# Altium project SmartSwitchD2_MainBoard_1v2.PrjPcb
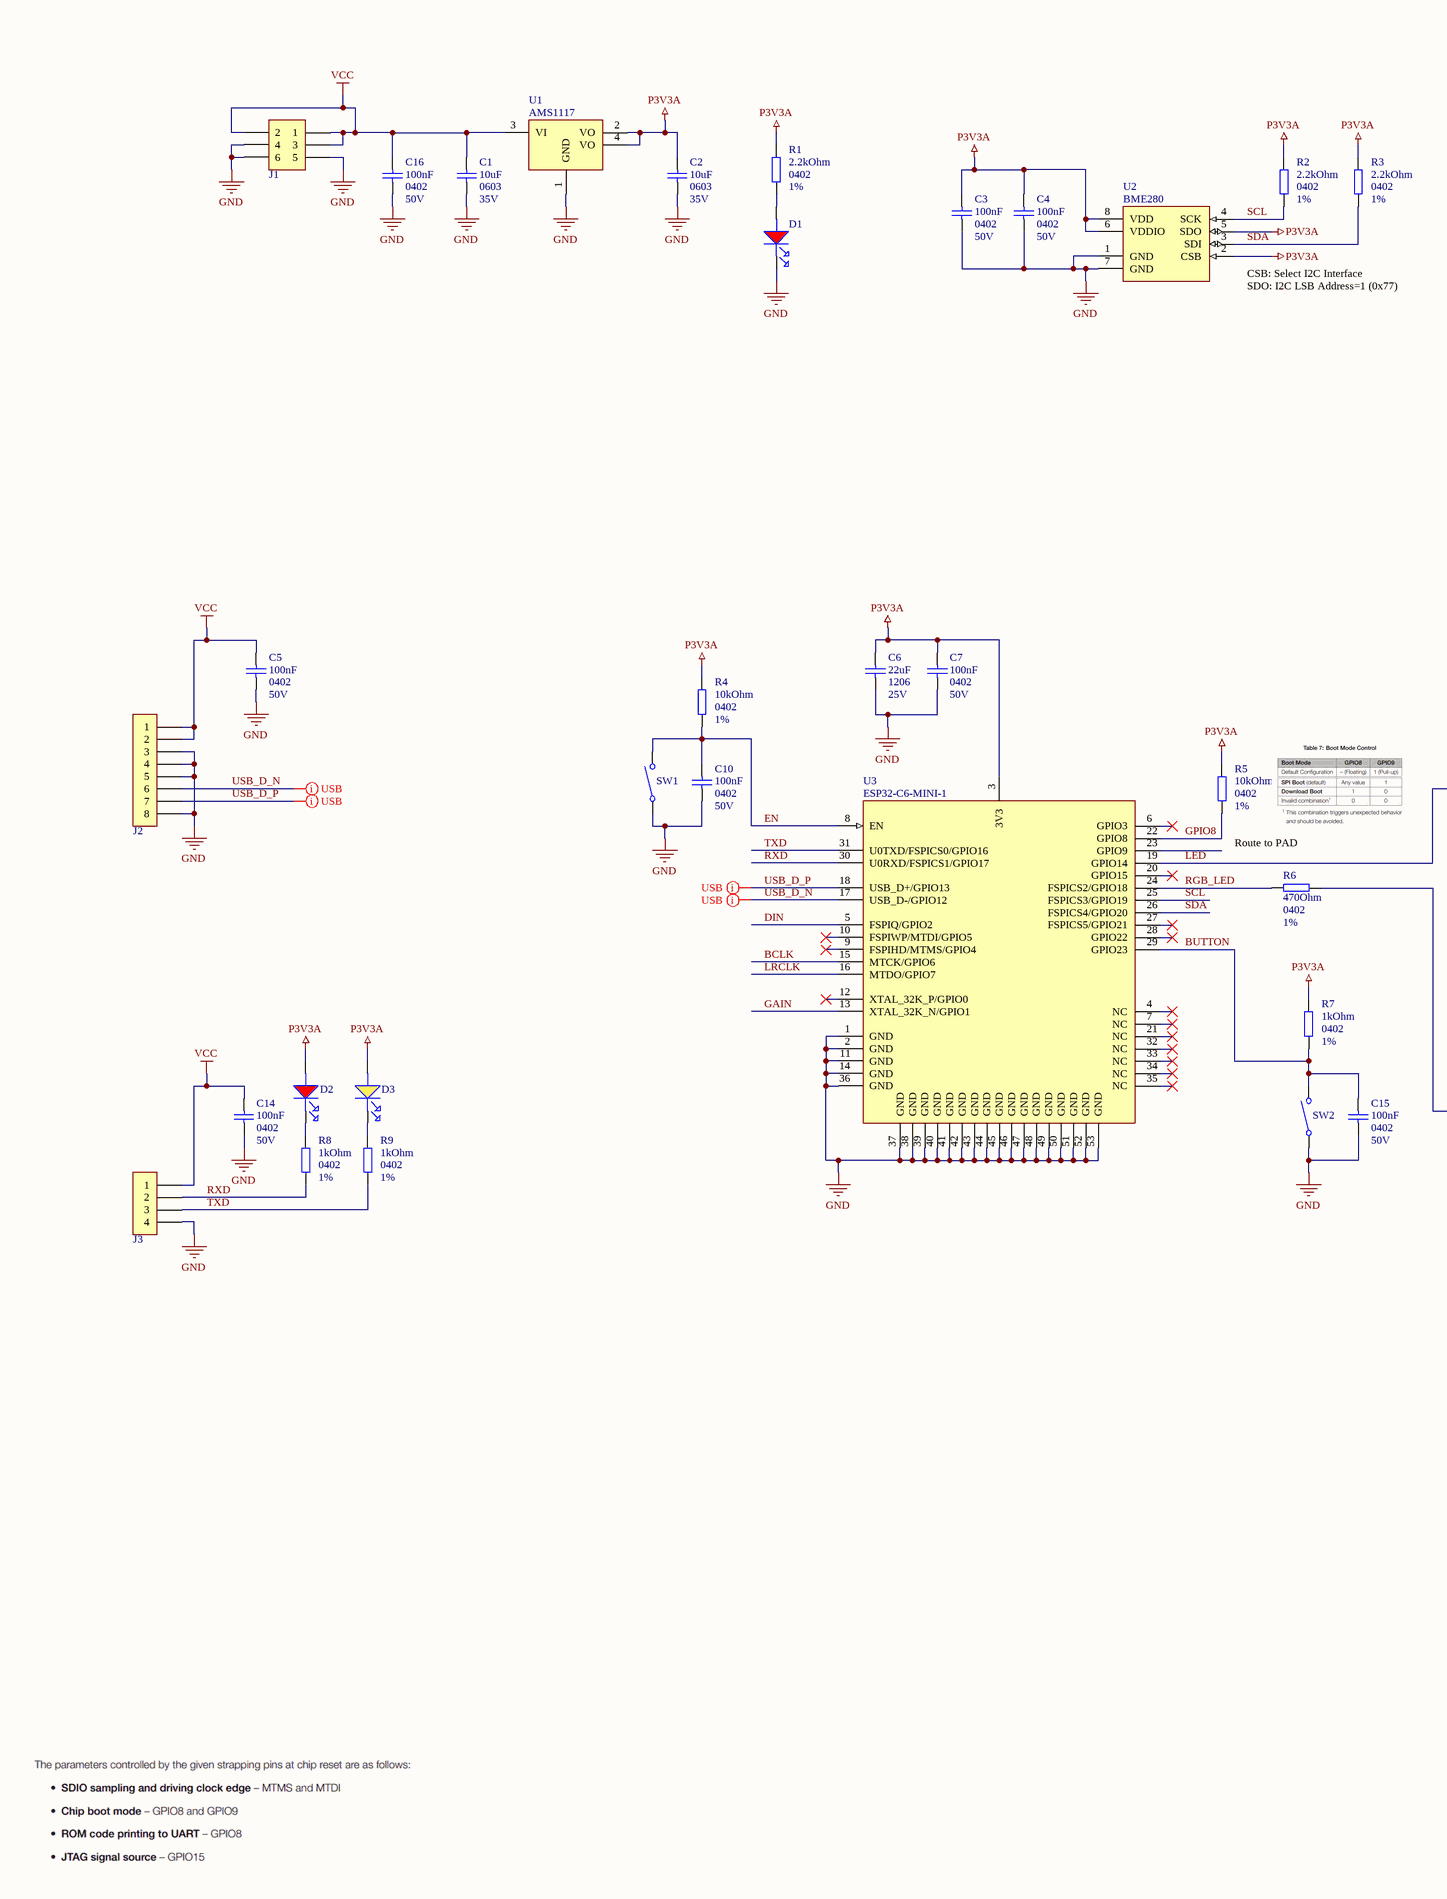
[diagram p0: 0_Main.SchDoc, left]
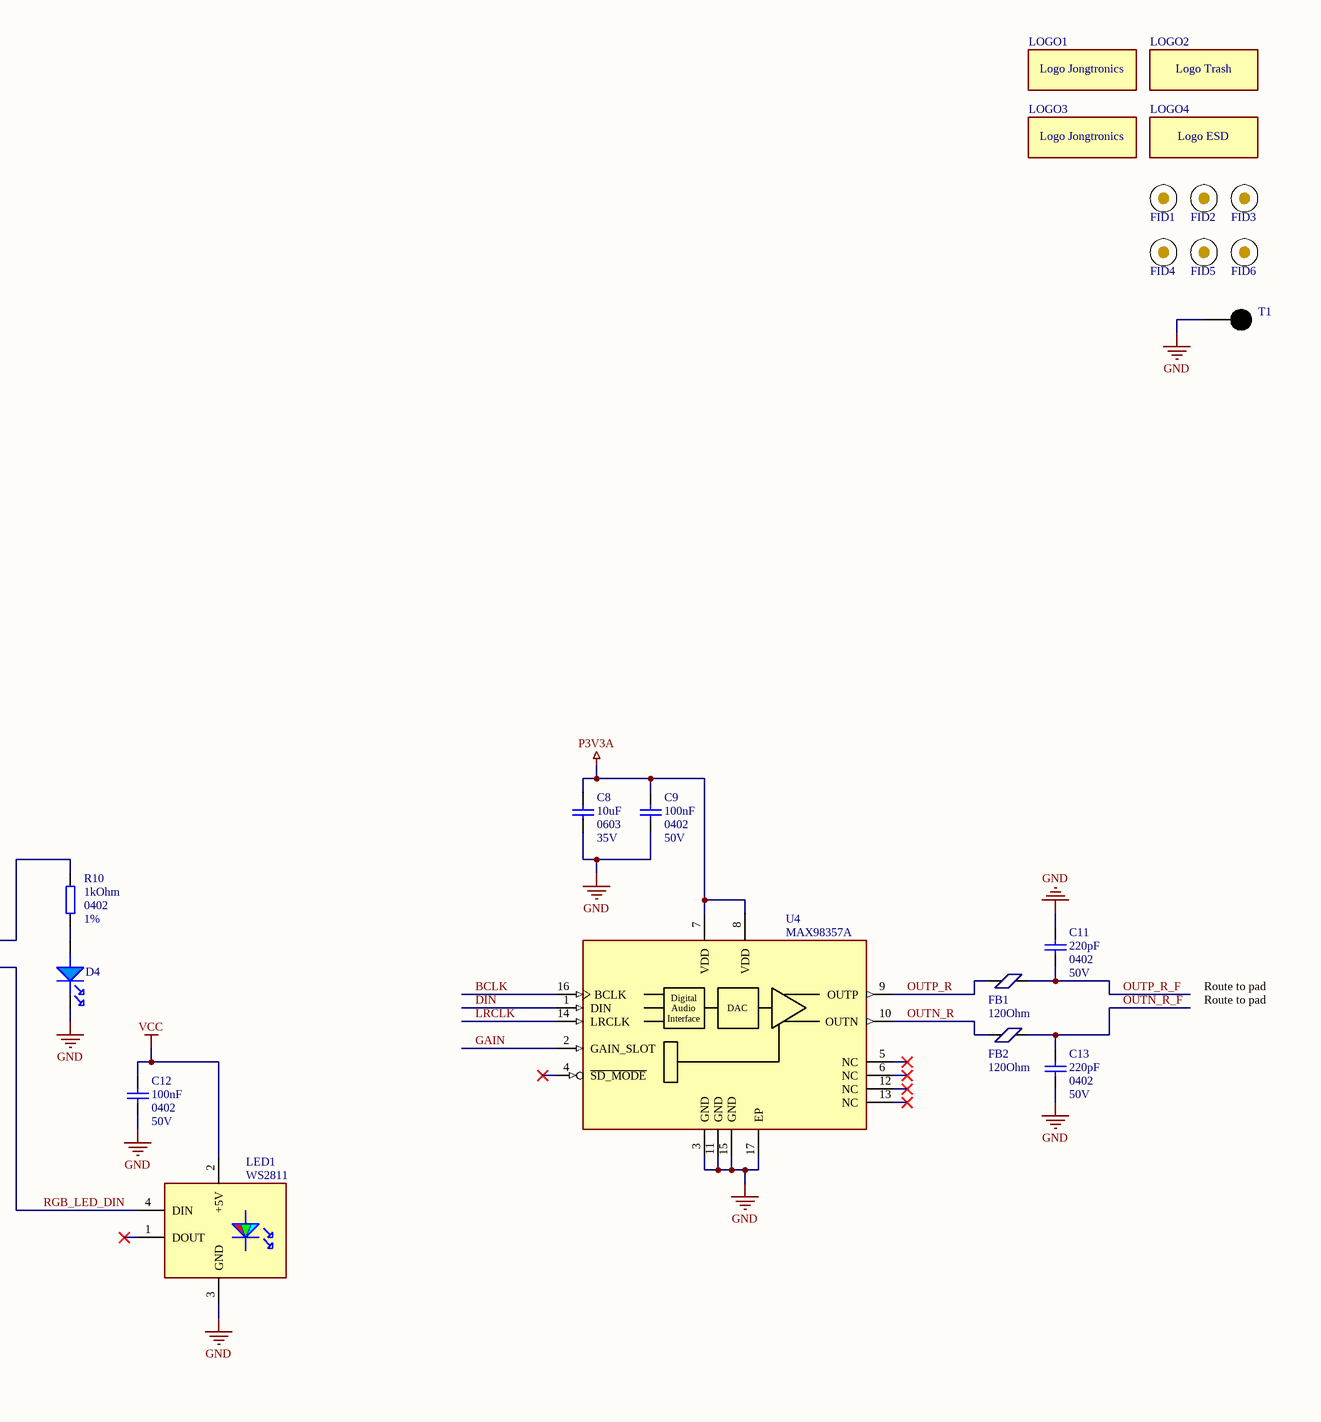
[diagram p1: 0_Main.SchDoc, right]
1 sheet, 53 parts. Net scope: global (net labels, ports and power ports of the same name join across sheets).
Board files: SmartSwitchD2_MainBoard_1v2.PCBDOC, SmartSwitch_PCB.PcbDoc

## Sheet 0_Main.SchDoc
size A2; DocumentNumber: 1; SheetNumber: 1; SheetTotal: 1

### Parts
C1  value 10uF  Footprint: 0603  Rated Voltage: 35V  [C0603]  (hidden comment: CAP-0603 10uF 35VDC 20% X5R)
C2  value 10uF  Footprint: 0603  Rated Voltage: 35V  [C0603]  (hidden comment: CAP-0603 10uF 35VDC 20% X5R)
C3  value 100nF  Footprint: 0402  Rated Voltage: 50V  [C0402]  (hidden comment: CAP-0402 100nF 50VDC 10% X7R)
C4  value 100nF  Footprint: 0402  Rated Voltage: 50V  [C0402]  (hidden comment: CAP-0402 100nF 50VDC 10% X7R)
C5  value 100nF  Footprint: 0402  Rated Voltage: 50V  [C0402]  (hidden comment: CAP-0402 100nF 50VDC 10% X7R)
C6  value 22uF  Footprint: 1206  Rated Voltage: 25V  [C1206]  (hidden comment: CAP-1206 22uF 25VDC 10% X5R)
C7  value 100nF  Footprint: 0402  Rated Voltage: 50V  [C0402]  (hidden comment: CAP-0402 100nF 50VDC 10% X7R)
C8  value 10uF  Footprint: 0603  Rated Voltage: 35V  [C0603]  (hidden comment: CAP-0603 10uF 35VDC 20% X5R)
C9  value 100nF  Footprint: 0402  Rated Voltage: 50V  [C0402]  (hidden comment: CAP-0402 100nF 50VDC 10% X7R)
C10  value 100nF  Footprint: 0402  Rated Voltage: 50V  [C0402]  (hidden comment: CAP-0402 100nF 50VDC 10% X7R)
C11  value 220pF  Footprint: 0402  Rated Voltage: 50V  [C0402]  (hidden comment: CAP-0402 220pF 50VDC 10% X7R)
C12  value 100nF  Footprint: 0402  Rated Voltage: 50V  [C0402]  (hidden comment: CAP-0402 100nF 50VDC 10% X7R)
C13  value 220pF  Footprint: 0402  Rated Voltage: 50V  [C0402]  (hidden comment: CAP-0402 220pF 50VDC 10% X7R)
C14  value 100nF  Footprint: 0402  Rated Voltage: 50V  [C0402]  (hidden comment: CAP-0402 100nF 50VDC 10% X7R)
C15  value 100nF  Footprint: 0402  Rated Voltage: 50V  [C0402]  (hidden comment: CAP-0402 100nF 50VDC 10% X7R)
C16  value 100nF  Footprint: 0402  Rated Voltage: 50V  [C0402]  (hidden comment: CAP-0402 100nF 50VDC 10% X7R)
D1  LED-0402 Red 1.8V 1mA  [LED0402]  (value not drawn)
D2  LED-0402 Red 1.8V 1mA  [LED0402]  (value not drawn)
D3  LED-0402 Yellow 1.9V 1mA  [LED0402]  (value not drawn)
D4  LED-0402 Blue 2.65V 2mA  [LED0402]  (value not drawn)
FB1  value 120Ohm  [FB0402]  (hidden comment: FB-0402 120R 0.55A 250mOhms)
FB2  value 120Ohm  [FB0402]  (hidden comment: FB-0402 120R 0.55A 250mOhms)
FID1  Fiducial  [FIDUCIAL]  (value not drawn)  (no BOM)
FID2  Fiducial  [FIDUCIAL]  (value not drawn)  (no BOM)
FID3  Fiducial  [FIDUCIAL]  (value not drawn)  (no BOM)
FID4  Fiducial  [FIDUCIAL]  (value not drawn)  (no BOM)
FID5  Fiducial  [FIDUCIAL]  (value not drawn)  (no BOM)
FID6  Fiducial  [FIDUCIAL]  (value not drawn)  (no BOM)
J1  Header Female 2x3 - 4.6mm height - 0.05" (1.27mm)  [HEADER FEMALE 2x3 1.27MM]  (value not drawn)
J2  PCB Connector JST SH1.0mm pitch SMD 1x8 Top Entry  [BM08B-SRSS-TB]  (value not drawn)
J3  PCB Connector JST SH1.0mm pitch SMD 1x4 Side Entry  [SM04B-SRSS-TB]  (value not drawn)
LED1  Footprint: WS2811  [WS2811 DIP]  (hidden comment: LED RGB 256 Levels 5V 5mm)
LOGO1  Logo Jongtronics  [LOGO_JONGTRONICS]  (value not drawn)  (no BOM)
LOGO2  Logo Trash  [LOGO_TRASH]  (value not drawn)  (no BOM)
LOGO3  Logo Jongtronics  [LOGO_JONGTRONICS]  (value not drawn)  (no BOM)
LOGO4  Logo ESD  [LOGO_ESD]  (value not drawn)  (no BOM)
R1  value 2.2kOhm  Footprint: 0402  Tolerance: 1%  [R0402]  (hidden comment: RES-0402 2.2k 50V 1% 62.5mW)
R2  value 2.2kOhm  Footprint: 0402  Tolerance: 1%  [R0402]  (hidden comment: RES-0402 2.2k 50V 1% 62.5mW)
R3  value 2.2kOhm  Footprint: 0402  Tolerance: 1%  [R0402]  (hidden comment: RES-0402 2.2k 50V 1% 62.5mW)
R4  value 10kOhm  Footprint: 0402  Tolerance: 1%  [R0402]  (hidden comment: RES-0402 10k 50V 1% 62.5mW)
R5  value 10kOhm  Footprint: 0402  Tolerance: 1%  [R0402]  (hidden comment: RES-0402 10k 50V 1% 62.5mW)
R6  value 470Ohm  Footprint: 0402  Tolerance: 1%  [R0402]  (hidden comment: RES-0402 470R 50V 1% 62.5mW)
R7  value 1kOhm  Footprint: 0402  Tolerance: 1%  [R0402]  (hidden comment: RES-0402 1k 50V 1% 125mW)
R8  value 1kOhm  Footprint: 0402  Tolerance: 1%  [R0402]  (hidden comment: RES-0402 1k 50V 1% 125mW)
R9  value 1kOhm  Footprint: 0402  Tolerance: 1%  [R0402]  (hidden comment: RES-0402 1k 50V 1% 125mW)
R10  value 1kOhm  Footprint: 0402  Tolerance: 1%  [R0402]  (hidden comment: RES-0402 1k 50V 1% 125mW)
SW1  Tactile Switch SMD/SMT PTS815  [SW PTS815 SJK 250]  (value not drawn)
SW2  Gateron KS-27 Low Profile 2.0 Mechanical Switch Set  [GATERON KS-27]  (value not drawn)
T1  PCB Test point BLACK 1mm hole  [TESTPIN BLACK 1MM]  (value not drawn)
U1  Linear LDO 3.3V 800mA  [SOT-223-4]  (value not drawn)
U2  Digital Sensor Temperature,Humidity,Pressure  [LGA-8]  (value not drawn)
U3  Part Number: ESP32-C6-MINI-1  [ESP32-CX-MINI-1]  (hidden comment: 2.4 GHz WiFi, Bluetooth 5 (LE), Zigbee and Thread module)
U4  Tiny, Low-Cost, PCM Class D Amplifier  [TQFN-16]  (value not drawn)

### Nets
GND: C1.1 C2.1 C3.1 C4.1 C5.1 C6.1 C7.1 C8.1 C9.1 C10.1 C11.1 C12.1 C13.1 C14.1 C15.1 C16.1 D1.1(K) D4.1 J1.4 J1.5 J1.6 J2.3 J2.4 J2.5 J2.8 J3.4 LED1.3(GND) SW1.1 SW2.1 T1.1 U1.1(GND) U2.1(GND) U2.7(GND) U3.1(GND) U3.2(GND) U3.11(GND) U3.14(GND) U3.36(GND) U3.37(GND) U3.38(GND) U3.39(GND) U3.40(GND) U3.41(GND) U3.42(GND) U3.43(GND) U3.44(GND) U3.45(GND) U3.46(GND) U3.47(GND) U3.48(GND) U3.49(GND) U3.50(GND) U3.51(GND) U3.52(GND) U3.53(GND) U4.3(GND) U4.11(GND) U4.15(GND) U4.17(EP)
P3V3A: C2.2 C3.2 C4.2 C6.2 C7.2 C8.2 C9.2 D2.2(A) D3.2(A) R1.2 R2.2 R3.2 R4.2 R5.2 R7.2 U1.2(VO) U1.4(VO) U2.2(CSB) U2.5(SDO) U2.6(VDDIO) U2.8(VDD) U3.3(3V3) U4.7(VDD) U4.8(VDD)
VCC: C1.2 C5.2 C12.2 C14.2 C16.2 J1.1 J1.2 J1.3 J2.1 J2.2 J3.1 LED1.2(+5V) U1.3(VI)
BCLK: U3.15(MTCK/GPIO6) U4.16(BCLK)
BUTTON: C15.2 R7.1 SW2.2 U3.29(GPIO23)
DIN: U3.5(FSPIQ/GPIO2) U4.1(DIN)
EN: C10.2 R4.1 SW1.2 U3.8(EN)
GAIN: U3.13(XTAL_32K_N/GPIO1) U4.2(GAIN_SLOT)
GPIO8: R5.1 U3.22(GPIO8)
LED: R10.2 U3.19(GPIO14)
LRCLK: U3.16(MTDO/GPIO7) U4.14(LRCLK)
OUTN_R: FB2.1 U4.10(OUTN)
OUTN_R_F: C13.2 FB2.2
OUTP_R: FB1.1 U4.9(OUTP)
OUTP_R_F: C11.2 FB1.2
RGB_LED: R6.2 U3.24(FSPICS2/GPIO18)
RGB_LED_DIN: LED1.4(DIN) R6.1
RXD: J3.2 R8.1 U3.30(U0RXD/FSPICS1/GPIO17)
SCL: R2.1 U2.4(SCK) U3.25(FSPICS3/GPIO19)
SDA: R3.1 U2.3(SDI) U3.26(FSPICS4/GPIO20)
TXD: J3.3 R9.1 U3.31(U0TXD/FSPICS0/GPIO16)
USB_D_N: J2.6 U3.17(USB_D-/GPIO12)
USB_D_P: J2.7 U3.18(USB_D+/GPIO13)
NetD1_2: D1.2(A) R1.1
NetD2_1: D2.1(K) R8.2
NetD3_1: D3.1(K) R9.2
NetD4_2: D4.2 R10.1

Not connected (* = marked no-connect by the designer): LED1 1(DOUT)*; U3 4(NC)* 6(GPIO3)* 7(NC)* 9(FSPIHD/MTMS/GPIO4)* 10(FSPIWP/MTDI/GPIO5)* 12(XTAL_32K_P/GPIO0)* 20(GPIO15)* 21(NC)* 23(GPIO9) 27(FSPICS5/GPIO21)* 28(GPIO22)* 32(NC)* 33(NC)* 34(NC)* 35(NC)*; U4 4(~{SD_MODE})* 5(NC)* 6(NC)* 12(NC)* 13(NC)*

### Layout directives
differential pair: USB_D_N, USB_D_P

### Notes on the sheet
- (near U2) CSB: Select I2C Interface
- (near U2) SDO: I2C LSB Address=1 (0x77)
- Route to PAD
- Route to pad
- Project Name:
- Size:
- Engineer:
- Revision:
- A2
- Jongtronics
- Rietlaan 5
- 3891GK
- Zeewolde
- Schematic:
- Sheet:
- of
- The Netherlands

### Library data of the parts
C1 C2 C8 = C 0603 10uF 35V: Manufacturer 1: Murata Electronics; Manufacturer Part Number 1: GRM188R6YA106MA73D; Default Designator: C?; Case-Metric: 1608; Part Number: C 0603 10uF 35V; Supplier 1: Mouser; Supplier Part Number 1: 81-GRM188R6YA106MA3D; Case-EIA: 0603; Tolerance: 20%; Datasheet: https://nl.mouser.com/datasheet/2/281/murata_03052018_GRM_Series_1-1310166.pdf
C3-C5 C7 C9 C10 C12 C14-C16 = C 0402 100nF 50V: Manufacturer 1: KYOCERA AVX; Manufacturer Part Number 1: 04025C104KAT4A; Default Designator: C?; Case-Metric: 1005; Part Number: C 0402 100nF 50V; Supplier 1: Mouser; Supplier Part Number 1: 581-04025C104KAT4A; Case-EIA: 0402; Tolerance: 10%; Datasheet: https://nl.mouser.com/datasheet/2/40/AVX_X7RDielectric_777024-1853642.pdf
C6 = C 1206 22uF 25V: CAP-1206 47uF 16VDC 20% X5R; Manufacturer 1: Samsung Electro-Mechanics; Manufacturer Part Number 1: CL31A226KAHNNNE; Default Designator: C?; Case-Metric: 3216; Part Number: C 1206 22uF 25V; Supplier 1: Mouser; Supplier Part Number 1: 187-CL31A226KAHNNNE; Case-EIA: 1206; Tolerance: 10%; Datasheet: https://nl.mouser.com/datasheet/2/585/MLCC-1837944.pdf
C11 C13 = C 0402 220pF 50V: Manufacturer 1: Murata Electronics; Manufacturer Part Number 1: GCM155R71H221KA37J; Default Designator: C?; Case-Metric: 1005; Part Number: C 0402 220pF 50V; Supplier 1: Mouser; Supplier Part Number 1: 81-GCM155R71H221KA7J; Case-EIA: 0402; Tolerance: 10%; Datasheet: https://nl.mouser.com/datasheet/2/281/murata_03122018_GCM_Series-1310150.pdf
D1 D2 = LED 0402 Red: Manufacturer 1: Rohm Semiconductor; Manufacturer Part Number 1: SML-P11UTT86R; Default Designator: D?; Case-EIA: 0402; Case-Metric: 1005; Part Number: LED 0402 Red; Footprint: 0402; Supplier 1: Digi-Key; Supplier Part Number 1: SML-P11UTT86RTR-ND; Rated Voltage: 1.8V; Value: 1mA; Datasheet: https://fscdn.rohm.com/en/products/databook/datasheet/opto/led/chip_mono/sml-p11-e.pdf
D3 = LED 0402 Yellow: Manufacturer 1: Rohm Semiconductor; Manufacturer Part Number 1: SML-P11YTT86; Default Designator: D?; Case-EIA: 0402; Case-Metric: 1005; Part Number: LED 0402 Yellow; Footprint: 0402; Supplier 1: Digi-Key; Supplier Part Number 1: 846-SML-P11YTT86TR-ND; Rated Voltage: 1.9V; Value: 1mA; Datasheet: https://fscdn.rohm.com/en/products/databook/datasheet/opto/led/chip_mono/sml-p11-e.pdf
D4 = LED 0402 Blue: Manufacturer 1: Kingbright; Manufacturer Part Number 1: APHHS1005LQBC/D-V; Default Designator: D?; Case-EIA: 0402; Case-Metric: 1005; Part Number: LED 0402 Blue; Footprint: 0402; Supplier 1: Digi-Key; Supplier Part Number 1: 754-2122-2-ND; Rated Voltage: 2.65V; Value: 2mA; Datasheet: https://www.kingbrightusa.com/images/catalog/SPEC/APHHS1005LQBC-D-V.pdf
FB1 FB2 = FB 0402 120Ohm: Manufacturer 1: Murata Electronics; Manufacturer Part Number 1: BLM15AG121SN1D; Default Designator: FB?; Case-EIA: 0402; Case-Metric: 1005; Tolerance: 25%; Part Number: FB 0402 120Ohm; Footprint: 0402; Supplier 1: Mouser; Supplier Part Number 1: 81-BLM15AG121SN1D; Datasheet: https://nl.mouser.com/datasheet/2/281/ENFA0018-1915754.pdf
FID1-FID6 = Fiducial: Default Designator: FID?; Part Number: Fiducial
J1 = Header Female 2x3 0.05" (1.27mm): Manufacturer 1: Harwin; Manufacturer Part Number 1: M50-3100345; Default Designator: J?; Part Number: Header Female 2x3 0.05" (1.27mm); Supplier 1: Mouser; Supplier Part Number 1: 855-M50-3100345; Datasheet: https://nl.mouser.com/datasheet/2/181/M50_310-1221016.pdf
J2 = Conn 1x8 JST SH1.0 Top Entry: Manufacturer 1: JST Sales America Inc.; Default Designator: J?; Part Number: Conn 1x8 JST SH1.0 Top Entry; Supplier 1: Digi-Key; Supplier Part Number 1: 455-1412-1-ND; Datasheet: https://media.digikey.com/pdf/Data%20Sheets/JST%20PDFs/SR%20Connector.pdf; Manufacturer Part Number 1: BM08B-SRSS-TB
J3 = Conn 1x4 JST SH1.0 Side Entry: Manufacturer 1: JST Sales America Inc.; Default Designator: J?; Part Number: Conn 1x4 JST SH1.0 Side Entry; Supplier 1: Digi-Key; Supplier Part Number 1: 455-SM04B-SRSS-TBTR-ND; Datasheet: https://www.jst-mfg.com/product/pdf/eng/eSH.pdf; Manufacturer Part Number 1: SM04B-SRSS-TB
LED1 = LED WS2811: Default Designator: LED?; Part Number: LED WS2811
LOGO1 LOGO3 = Logo Jongtronics: Default Designator: LOGO?; Part Number: Logo Jongtronics
LOGO2 = Logo Trash: Default Designator: LOGO?; Part Number: Logo Trash
LOGO4 = Logo ESD: Default Designator: LOGO?; Part Number: Logo ESD
R1-R3 = R 0402 2.2kOhm: Manufacturer 1: Vishay / Dale; Manufacturer Part Number 1: CRCW04022K20FKEDC; Default Designator: R?; Case-Metric: 1005; Part Number: R 0402 2.2kOhm; Supplier 1: Mouser; Supplier Part Number 1: 71-CRCW04022K20FKEDC; Case-EIA: 0402; Rated Voltage: 50V; Datasheet: https://nl.mouser.com/datasheet/2/447/PYu-RC_Group_51_RoHS_L_10-1527934.pdf
R4 R5 = R 0402 10kOhm: Manufacturer 1: Vishay / Dale; Manufacturer Part Number 1: CRCW040210K0FKEDC; Default Designator: R?; Case-Metric: 1005; Part Number: R 0402 10kOhm; Supplier 1: Mouser; Supplier Part Number 1: 71-CRCW040210K0FKEDC; Case-EIA: 0402; Rated Voltage: 50V; Datasheet: https://nl.mouser.com/datasheet/2/427/crcwce3-1223726.pdf
R6 = R 0402 470Ohm: Manufacturer 1: Bourns; Manufacturer Part Number 1: CR0402-FX-4700GLF; Default Designator: R?; Case-Metric: 1005; Part Number: R 0402 470Ohm; Supplier 1: Mouser; Supplier Part Number 1: 652-CR0402FX-4700GLF; Case-EIA: 0402; Rated Voltage: 50V; Datasheet: https://nl.mouser.com/datasheet/2/54/cr-1858361.pdf
R7-R10 = R 0402 1kOhm: Manufacturer 1: Yageo; Manufacturer Part Number 1: RC0402FR-7W1KL; Default Designator: R?; Case-Metric: 1005; Part Number: R 0402 1kOhm; Supplier 1: Mouser; Supplier Part Number 1: 603-RC0402FR-7W1KL; Case-EIA: 0402; Rated Voltage: 50V; Datasheet: https://nl.mouser.com/datasheet/2/447/PYu-RC_Group_51_RoHS_L_10-1527934.pdf
SW1 = SW Tactile PTS815: Manufacturer 1: C&K; Manufacturer Part Number 1: PTS815 SJK 250 SMTR LFS; Default Designator: SW?; Part Number: SW Tactile PTS815; Supplier 1: Mouser; Supplier Part Number 1: 611-PTS815SJK250SMTR; Datasheet: https://nl.mouser.com/datasheet/2/240/pts815-3050953.pdf
SW2 = Gateron KS-27: Default Designator: SW?; Part Number: Gateron KS-27; Datasheet: https://cdn.shopify.com/s/files/1/0565/8070/2297/files/SPEC-KS-27C10B050NN-X5-Low_Profile_Blue_Switch.pdf?v=1667274518; Manufacturer 1: Gateron; Manufacturer Part Number 1: KS-27
T1 = Testpoint BLACK: Manufacturer 1: Keystone Electronics; Manufacturer Part Number 1: 5001; Default Designator: T?; Part Number: Testpoint BLACK; Supplier 1: Mouser; Supplier Part Number 1: 534-5001; Datasheet: https://nl.mouser.com/datasheet/2/215/000-5004-741320.pdf
U1 = AMS1117: Manufacturer 1: Texas Instruments; Manufacturer Part Number 1: LM1117MPX-3.3/NOPB; Default Designator: U?; Part Number: AMS1117; Supplier 1: Mouser; Supplier Part Number 1: 926-LM1117MPX3.3NOPB; Datasheet: https://www.ti.com/lit/ds/symlink/lm1117.pdf?HQS=dis-mous-null-mousermode-dsf-pf-null-wwe&ts=1663860104048&ref_url=https%253A%252F%252Fwww.mouser.fi%252F
U2 = BME280: Manufacturer 1: Bosch; Default Designator: U?; Part Number: BME280; Supplier 1: Mouser; Supplier Part Number 1: 262-BME280; Datasheet: https://www.mouser.com/datasheet/2/783/BST-BME280-DS002-1509607.pdf; Manufacturer Part Number 1: BME280
U3 = ESP32-C6-MINI-1: Manufacturer 1: Espressif Systems; Manufacturer Part Number 1: ESP32-C6-MINI-1-N4; Default Designator: U?; Supplier 1: Mouser; Supplier Part Number 1: 356-ESP32C6MINI-1-N4; Datasheet: https://www.espressif.com/sites/default/files/documentation/esp32-c6-mini-1_mini-1u_datasheet_en.pdf
U4 = MAX98357A: Manufacturer 1: Analog Devices; Manufacturer Part Number 1: MAX98357AETE+T; Default Designator: U?; Part Number: MAX98357A; Supplier 1: Mouser; Supplier Part Number 1: 700-MAX98357AETE+T; Datasheet: https://nl.mouser.com/datasheet/2/609/MAX98357A_MAX98357B-3131172.pdf